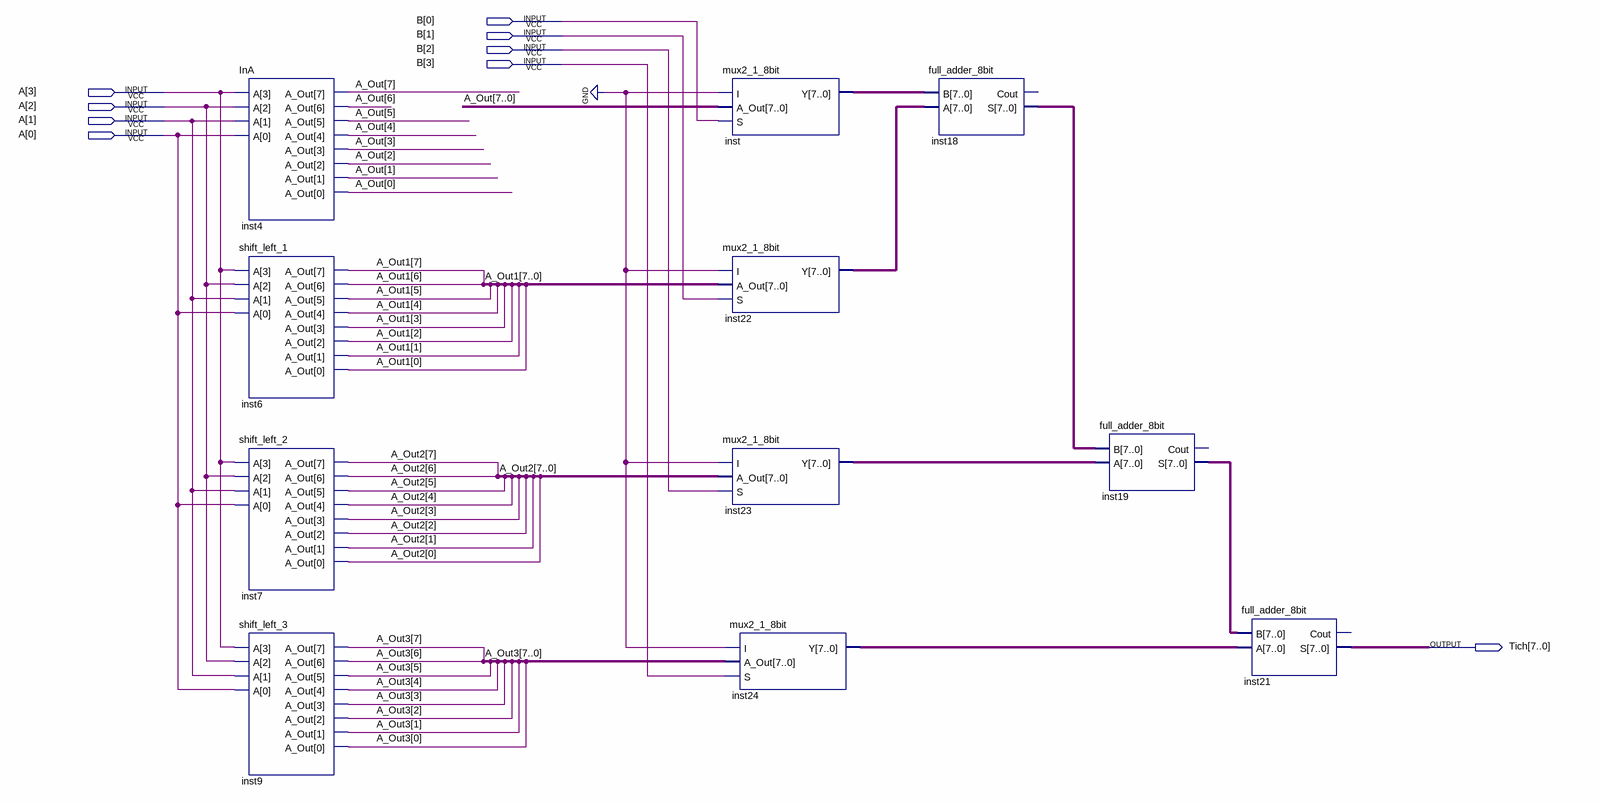
[diagram p0: schematic sheet]
// Quartus schematic nhan.bdf as structural Verilog: 11 symbols, 9 pins
module nhan (
  input  [3:0] B,
  input  [3:0] A,
  output [7:0] Tich
);

  wire [7:0] A_Out, A_Out1, A_Out2, A_Out3, inst18_s, inst19_s, inst22_y, inst23_y, inst24_y, inst_y;

  InA inst4 (.A(A), .A_Out(A_Out));
  shift_left_1 inst6 (.A(A), .A_Out(A_Out1));
  shift_left_2 inst7 (.A(A), .A_Out(A_Out2));
  shift_left_3 inst9 (.A(A), .A_Out(A_Out3));
  mux2_1_8bit inst (.I(1'b0), .A_Out(A_Out), .S(B[0]), .Y(inst_y));
  mux2_1_8bit inst22 (.I(1'b0), .A_Out(A_Out1), .S(B[1]), .Y(inst22_y));
  mux2_1_8bit inst23 (.I(1'b0), .A_Out(A_Out2), .S(B[2]), .Y(inst23_y));
  mux2_1_8bit inst24 (.I(1'b0), .A_Out(A_Out3), .S(B[3]), .Y(inst24_y));
  full_adder_8bit inst18 (.B(inst_y), .A(inst22_y), .S(inst18_s));  // open: Cout
  full_adder_8bit inst19 (.B(inst18_s), .A(inst23_y), .S(inst19_s));  // open: Cout
  full_adder_8bit inst21 (.B(inst19_s), .A(inst24_y), .S(Tich));  // open: Cout
endmodule
